# Altium schematic sheet ESP32.SchDoc
size A4; SheetNumber: 4; SheetTotal: 4
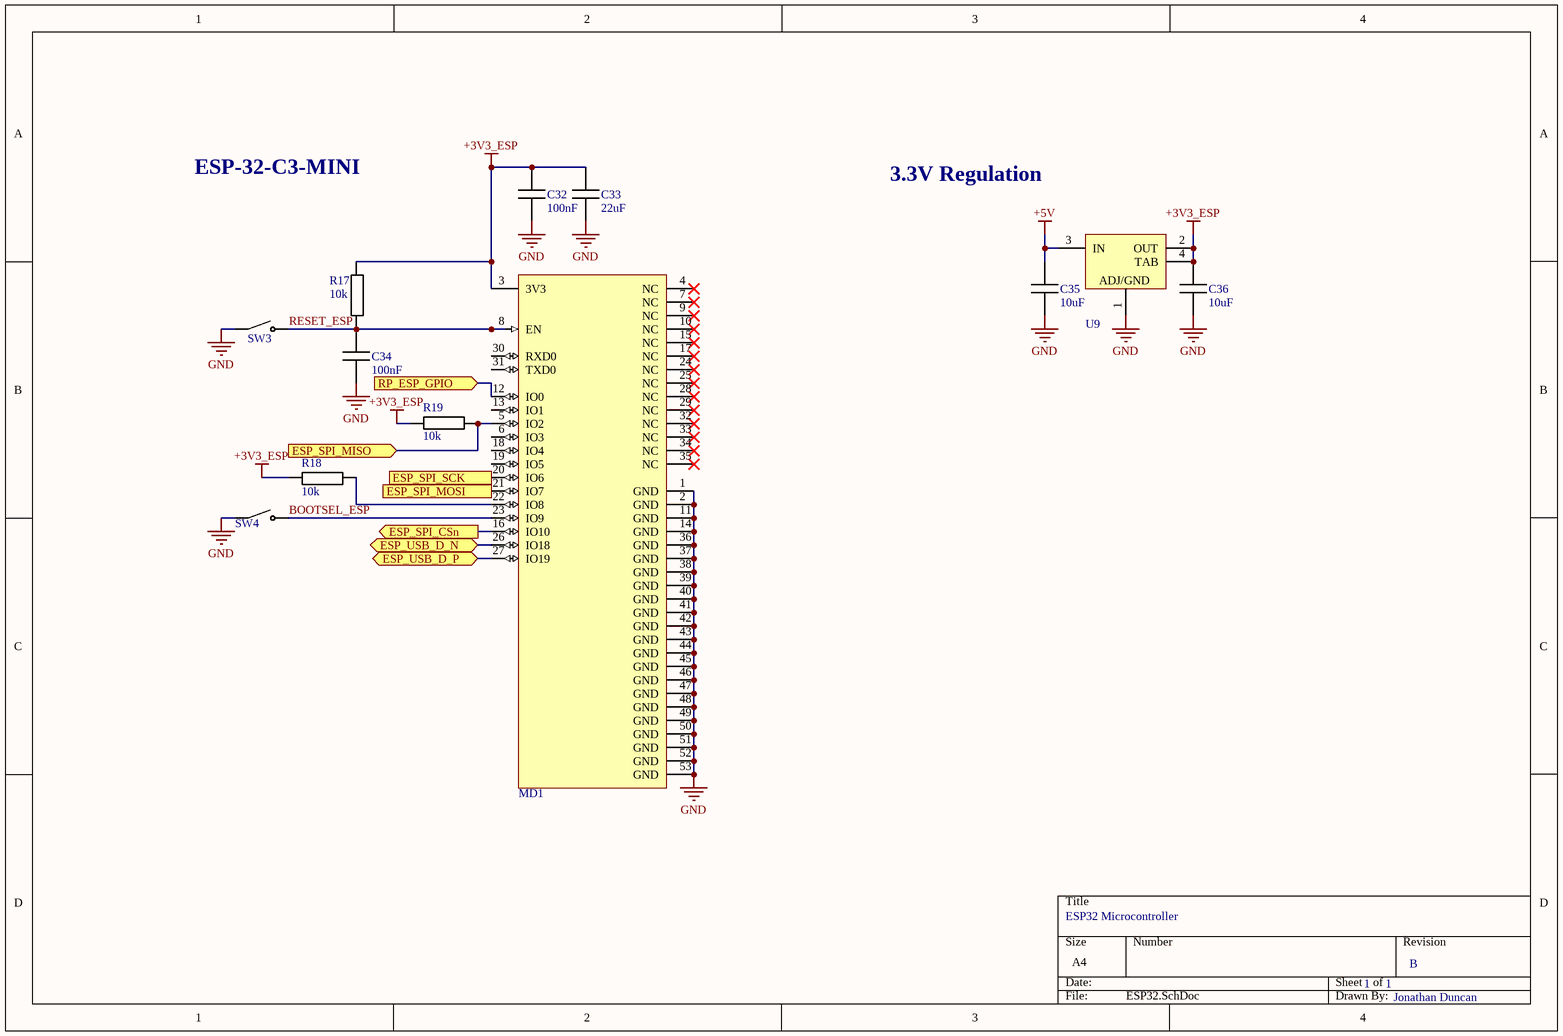
[diagram p0: ESP32.SchDoc]

## Parts
C32  value 100nF  [FP-CC0603-DA-IPC_B]  (hidden comment: Cap 100nF 0603)
C33  value 22uF  [FP-CC0603-DA-IPC_B]  (hidden comment: Cap 22uF 0603)
C34  value 100nF  [FP-CC0603-DA-IPC_B]  (hidden comment: Cap 100nF 0603)
C35  value 10uF  [FP-CC0603-DA-IPC_B]  (hidden comment: Cap 10uF 0603)
C36  value 10uF  [FP-CC0603-DA-IPC_B]  (hidden comment: Cap 10uF 0603)
MD1  ESP32-C3-MINI-1-H4  [FP-ESP32-C3-MINI-1-H4-MFG]  (value not drawn)
R17  value 10k  [FP-RC0603-0_55-IPC_B]  (hidden comment: Res 10k 0603)
R18  value 10k  [FP-RC0603-0_55-IPC_B]  (hidden comment: Res 10k 0603)
R19  value 10k  [FP-RC0603-0_55-IPC_B]  (hidden comment: Res 10k 0603)
SW3  TS-1088-AR02016  [3x4 Tactile Switch]  (value not drawn)
SW4  TS-1088-AR02016  [3x4 Tactile Switch]  (value not drawn)
U9  NCP1117ST33T3G  [ONSC-SOT-223-4-318H-01_A_V]  (value not drawn)

## Ports
ESP_SPI_CSn (out), ESP_SPI_MISO (in), ESP_SPI_MOSI (out), ESP_SPI_SCK (out), ESP_USB_D_N (bidir), ESP_USB_D_P (bidir), RP_ESP_GPIO (in)

## Nets
+3V3_ESP: C32.2 C33.2 C36.2 MD1.3(3V3) R17.2 R18.1 R19.2 U9.2(OUT) U9.4(TAB)
+5V: C35.2 U9.3(IN)
GND: C32.1 C33.1 C34.1 C35.1 C36.1 MD1.1(GND) MD1.2(GND) MD1.11(GND) MD1.14(GND) MD1.36(GND) MD1.37(GND) MD1.38(GND) MD1.39(GND) MD1.40(GND) MD1.41(GND) MD1.42(GND) MD1.43(GND) MD1.44(GND) MD1.45(GND) MD1.46(GND) MD1.47(GND) MD1.48(GND) MD1.49(GND) MD1.50(GND) MD1.51(GND) MD1.52(GND) MD1.53(GND) SW3.1 SW4.1 U9.1(ADJ/GND)
BOOTSEL_ESP: MD1.23(IO9) SW4.2
ESP_SPI_CSn: MD1.16(IO10) ; port ESP_SPI_CSn
ESP_SPI_MISO: MD1.5(IO2) R19.1 ; port ESP_SPI_MISO
ESP_SPI_MOSI: MD1.21(IO7) ; port ESP_SPI_MOSI
ESP_SPI_SCK: MD1.20(IO6) ; port ESP_SPI_SCK
ESP_USB_D_N: MD1.26(IO18) ; port ESP_USB_D_N
ESP_USB_D_P: MD1.27(IO19) ; port ESP_USB_D_P
RESET_ESP: C34.2 MD1.8(EN) R17.1 SW3.2
RP_ESP_GPIO: MD1.12(IO0) ; port RP_ESP_GPIO
NetMD1_22: MD1.22(IO8) R18.2

Not connected (* = marked no-connect by the designer): MD1 4(NC)* 6(IO3) 7(NC)* 9(NC)* 10(NC)* 13(IO1) 15(NC)* 17(NC)* 18(IO4) 19(IO5) 24(NC)* 25(NC)* 28(NC)* 29(NC)* 30(RXD0) 31(TXD0) 32(NC)* 33(NC)* 34(NC)* 35(NC)*

## Notes on the sheet
- ESP-32-C3-MINI
- 3.3V Regulation
- ESP32 Microcontroller
- 1
- B
- Jonathan Duncan

## Library data of the parts
C32 C34 = CMP-00006-5: 100nF 50V 10% X7R 0603 SMD Capacitor Decoupling; Temperature Coefficient: X7R; Mounting Technology: SMT; Tolerance: 10%; Case/Package: 0603; Voltage Rating: 50V
C33 = CMP-001-00003-1: 22uF 6.3V 20% X5R 0603 SMD Capacitor; Case/Package: 0603; Mounting Technology: SMT; Voltage Rating: 6.3V; Tolerance: 20%; Temperature Coefficient: X5R
C35 C36 = CMP-001-00002-1: 10uF 6.3V 10% X5R 0603 SMD Capacitor; Mounting Technology: SMT; Voltage Rating: 6.3V; Case/Package: 0603; Tolerance: 10%; Temperature Coefficient: X5R
MD1 = CMP-00032-1: -96dBm 20.5dBm On-board PCB antenna 2.4GHz SMD, 13.2x16.6mm WiFi Modules ROHS
R17-R19 = CMP-009-00000-1: 10k 1% 100mW 0603 SMD Resistor; Case/Package: 0603; Power Rating: 100mW; Mounting Technology: SMT; Tolerance: 1%
SW3 SW4 = CMP-002-000002-2: 3*4*2.0 160GF Surface mount no-post tactile switch
U9 = CMP-00015-1: NCP1117 Series 1 A 3.3 V Fixed Output LDO Positive Voltage Regulator - SOT-223; Max Supply Voltage: 15V; Min Input Voltage: 4.75V; Nominal Output Voltage: 3.3V; Pins: 4